# Altium project Main-PCB-v1.1.PrjPcb (part 2 of 2)

## Sheet Arc-Igniter-Sheet.SchDoc
size A4; SheetNumber: 3; SheetTotal: 4
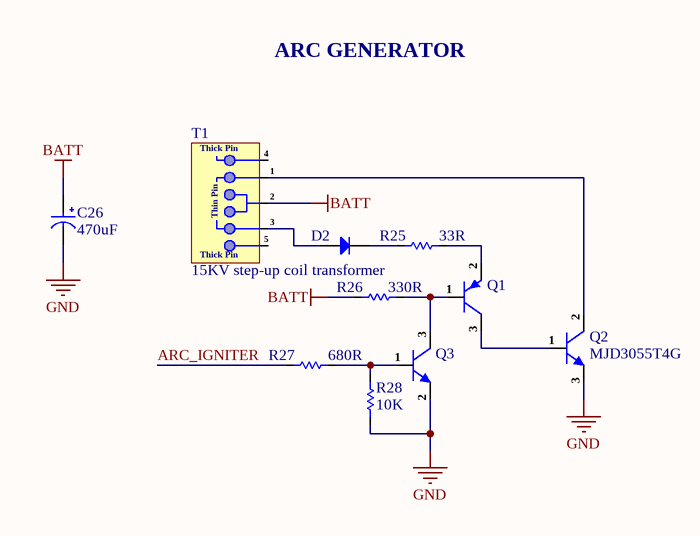
[diagram p2: Arc-Igniter-Sheet.SchDoc]

### Parts
C26  470uF  [Case-E]
D2  UF4007  [DO-41]  (value not drawn)
Q1  PMBT2907A,215  [SOT-23]  (value not drawn)
Q2  MJD3055T4G  [DPAK]
Q3  MMBT2222A-7-F  [SOT-23]  (value not drawn)
R25  33R  [MFR03SF330JA10]
R26  330R  [Res-0603]
R27  680R  [Res-0402]
R28  10K  [Res-0402]
T1  15KV step-up coil transformer  [15KV step-up coil transformer]

### Nets
BATT: C26.1 R26.1 T1.2
GND: C26.2 Q2.3(E) Q3.2(E) R28.1
ARC_IGNITER: R27.1
NetD2_1: D2.1(A) T1.3
NetD2_2: D2.2(K) R25.1
NetQ1_1: Q1.1(B) Q3.3(C) R26.2
NetQ1_2: Q1.2(E) R25.2
NetQ1_3: Q1.3(C) Q2.1(B)
NetQ2_2: Q2.2(C) T1.1
NetQ3_1: Q3.1(B) R27.2 R28.2

### Notes on the sheet
- ARC GENERATOR
- File:
- Title:
- Date:
- Page
- Num:
- Total:
- Drawn By: Huzaifa Ali
- (in symbol 15KV step-up coil transformer) Thick Pin; 4; Thin Pin; 5

### Library data of the parts
C26 = TAJE477K010RNJ: CAP TANT 470UF 10% 10V 2917; Manufacturer: Kyocera AVX; Dielectric Material: Tantalum; ESR (Equivalent Series Resistance): 500mR; Leakage Current: 47uA; Polarity: Polar; Item Type: Capacitor; Supplier 1: Arrow Electronics; Manufacturer Part Number: TAJE477K010RNJ; RoHS: Yes; Category: Tantalum Capacitors; Stock 1: 5; Pricing 1: 1=1.3181 (USD); Mounting Technology: Surface Mount,PCB; Case/Package: 2917; Pins: 2; Case Code (Imperial): 2917; Case Code (Metric): 7343; Min Operating Temperature: -55°C; Max Operating Temperature: 125°C; Value: 470uF; Tolerance: 10%; Packaging: Tape and Reel; Voltage Rating: 10V; Voltage Rating (DC): 10V; Package Quantity: 400; Termination: SMD/SMT; Voltage: 10V; Dissipation Factor: 10%; Features: General Purpose; Series: TAJ; Construction: Flat; Length: 7.3mm; Width: 4.3mm; Height: 4.1mm; Depth: 4.3mm; Lead Pitch: 4.4mm; Radiation Hardening: No; Reach SVHC Compliant: No; Lead Free: Lead Free; RoHS Compliant: Yes; ComponentLink1URL: https://datasheet.ciiva.com/7832/taj-7832508.pdf?src-supplier=Element14; ComponentLink1Description: https://datasheet.ciiva.com/7832/taj-7832508.pdf?src-supplier=Element14; ComponentLink2URL: https://datasheet.ciiva.com/7832/taj-7832507.pdf?src-supplier=Element14; ComponentLink2Description: https://datasheet.ciiva.com/7832/taj-7832507.pdf?src-supplier=Element14; ComponentLink3URL: https://datasheet.ciiva.com/265/taj-265547.pdf?src-supplier=Digi-Key; ComponentLink3Description: https://datasheet.ciiva.com/265/taj-265547.pdf?src-supplier=Digi-Key; ComponentLink4URL: https://datasheet.ciiva.com/265/taj-265546.pdf?src-supplier=Digi-Key; ComponentLink4Description: https://datasheet.ciiva.com/265/taj-265546.pdf?src-supplier=Digi-Key; ComponentLink5URL: https://datasheet.ciiva.com/265/taj-265548.pdf?src-supplier=Digi-Key; ComponentLink5Description: https://datasheet.ciiva.com/265/taj-265548.pdf?src-supplier=Digi-Key; ComponentLink6URL: https://datasheet.ciiva.com/12882/taj-27497-12882504.pdf?src-supplier=Mouser; ComponentLink6Description: https://datasheet.ciiva.com/12882/taj-27497-12882504.pdf?src-supplier=Mouser; ComponentLink7URL: https://datasheet.ciiva.com/14602/70001050-14602312.pdf?src-supplier=Allied+Electronics; ComponentLink7Description: https://datasheet.ciiva.com/14602/70001050-14602312.pdf?src-supplier=Allied+Electronics; ComponentLink8URL: https://datasheet.ciiva.com/14600/70001050-14600301.pdf?src-supplier=Allied+Electronics; ComponentLink8Description: https://datasheet.ciiva.com/14600/70001050-14600301.pdf?src-supplier=Allied+Electronics; ComponentLink9URL: https://datasheet.ciiva.com/11229/taj-11229470.pdf?src-supplier=Avnet; ComponentLink9Description: https://datasheet.ciiva.com/11229/taj-11229470.pdf?src-supplier=Avnet; ComponentLink10URL: https://datasheet.ciiva.com/16330/taj-16330918.pdf?src-supplier=Future+Electronics; ComponentLink10Description: https://datasheet.ciiva.com/16330/taj-16330918.pdf?src-supplier=Future+Electronics; Supplier Part Number 1: TAJE477K010RNJ; LCSC Part Number: C7234
D2 = UF4007: 1.7V@1A 75ns 1A 1kV DO-41 Fast Recovery / High Efficiency Diodes ROHS; Manufacturer: MDD(Microdiode Semiconductor); Item Type: Diode; Manufacturer Part Number: UF4007; Package: DO-41; LCSC Part Number: C960666; ComponentLink1Description: LCSC; ComponentLink1URL: https://www.lcsc.com/product-detail/Fast-Recovery-High-Efficiency-Diodes_MDD-Microdiode-Semiconductor-UF4007_C960666.html
Q1 = PMBT2907A,215: TRANS PNP 60V 0.6A TO236AB; Manufacturer: Nexperia; Collector Emitter Voltage (VCEO): -60V; Emitter Base Voltage (VEBO): -5V; Max Collector Current: -600mA; Polarity: 5054,5055Direction; Collector Emitter Saturation Voltage: -1.6V; hFE Min: 100NUMBER; Number of Elements: 1NUMBER; Power Dissipation: 250mW; Item Type: (BJT); Supplier: Arrow Electronics; LCSC Part Number: C8665; Manufacturer Part Number: PMBT2907A,215; RoHS: Yes; Category: BJTs; Stock: 441000; Pricing: 3000=0.018, 9000=0.017, 24000=0.016, 45000=0.015 (USD); Pins: 3NUMBER; Max Operating Temperature: 150°C; Collector Base Voltage (VCBO): -60V; Packaging: 10Packaging; Height: 1.1mm; ComponentLink1URL: https://media.digikey.com/pdf/Data%20Sheets/NXP%20PDFs/PMBT2907(A).pdf?src-supplier=Digikey; ComponentLink1Description: https://media.digikey.com/pdf/Data%20Sheets/NXP%20PDFs/PMBT2907(A).pdf?src-supplier=Digikey; ComponentLink2URL: http://www.farnell.com/datasheets/1914007.pdf?src-supplier=Farnell; ComponentLink2Description: http://www.farnell.com/datasheets/1914007.pdf?src-supplier=Farnell; ComponentLink3URL: https://datasheet.octopart.com/PMBT2907A%2C215-Nexperia-datasheet-87581832.pdf?src-supplier=Future+Electronics; ComponentLink3Description: https://datasheet.octopart.com/PMBT2907A%2C215-Nexperia-datasheet-87581832.pdf?src-supplier=Future+Electronics; ComponentLink4URL: https://datasheet.octopart.com/PMBT2907A%2C215-Nexperia-datasheet-38276499.pdf?src-supplier=Newark; ComponentLink4Description: https://datasheet.octopart.com/PMBT2907A%2C215-Nexperia-datasheet-38276499.pdf?src-supplier=Newark
Q2 = MJD3055T4G: TRANS NPN 60V 10A DPAK; Manufacturer: ON Semiconductor; Item Type: Mosfet; Supplier: Future Electronics; LCSC Part Number: C150250; Manufacturer Part Number: MJD3055T4G; RoHS: Yes; Stock: 2500; Pricing: 2500=0.27, 5000=0.265, 7500=0.26 (USD); ComponentLink1URL: https://datasheet.ciiva.com/7972/79237-7972276.pdf?src-supplier=Element14; ComponentLink1Description: https://datasheet.ciiva.com/7972/79237-7972276.pdf?src-supplier=Element14; ComponentLink2URL: https://datasheet.ciiva.com/15139/getdatasheetpartid-91662-15139167.pdf?src-supplier=Verical; ComponentLink2Description: https://datasheet.ciiva.com/15139/getdatasheetpartid-91662-15139167.pdf?src-supplier=Verical; ComponentLink3URL: https://datasheet.ciiva.com/16462/mjd2955-d-16462217.pdf?src-supplier=Future+Electronics; ComponentLink3Description: https://datasheet.ciiva.com/16462/mjd2955-d-16462217.pdf?src-supplier=Future+Electronics; ComponentLink4URL: https://datasheet.ciiva.com/6357/mjd2955-d-6357033.pdf?src-supplier=Digikey; ComponentLink4Description: https://datasheet.ciiva.com/6357/mjd2955-d-6357033.pdf?src-supplier=Digikey; ComponentLink5URL: https://datasheet.ciiva.com/981/mjd2955-d-981380.pdf?src-supplier=Digikey; ComponentLink5Description: https://datasheet.ciiva.com/981/mjd2955-d-981380.pdf?src-supplier=Digikey; ComponentLink6URL: https://datasheet.ciiva.com/981/mjd2955-d-981381.pdf?src-supplier=Digikey; ComponentLink6Description: https://datasheet.ciiva.com/981/mjd2955-d-981381.pdf?src-supplier=Digikey; ComponentLink7URL: https://datasheet.ciiva.com/11198/mjd2955-d-11198541.pdf?src-supplier=Avnet; ComponentLink7Description: https://datasheet.ciiva.com/11198/mjd2955-d-11198541.pdf?src-supplier=Avnet; ComponentLink8URL: https://datasheet.ciiva.com/11205/mjd2955-d-11205173.pdf?src-supplier=Avnet; ComponentLink8Description: https://datasheet.ciiva.com/11205/mjd2955-d-11205173.pdf?src-supplier=Avnet
Q3 = MMBT2222A-7-F: TRANS NPN 40V 0.6A SMD SOT23-3; Manufacturer: Diodes; Max Power Dissipation: 300mW; Collector Base Voltage (VCBO): 75V; Max Collector Current: 600mA; hFE Min: 100; Frequency: 300MHz; Number of Elements: 1; Emitter Base Voltage (VEBO): 6V; Collector Emitter Saturation Voltage: 1V; Power Dissipation: 350mW; Element Configuration: Single; Current: 1A; Item Type: Mosfet; Supplier 1: Digi-Key; Manufacturer Part Number: MMBT2222A-7-F; Stock 1: 2471182; Pricing 1: 1=0.15, 10=0.134, 100=0.0729, 500=0.04486, 1000=0.03059 (USD); Mount: Surface Mount; Case/Package: SOT-23; Number of Pins: 3; Weight: 0.000282oz; Contact Plating: Matte,Tin; Min Operating Temperature: -55°C; Max Operating Temperature: 150°C; Packaging: Tape and Reel; Collector Emitter Voltage (VCEO): 40V; Polarity: NPN; Voltage Rating (DC): 40V; Package Quantity: 3000; Continuous Collector Current: 600mA; Collector Emitter Breakdown Voltage: 40V; Transition Frequency: 300MHz; Max Breakdown Voltage: 40V; Max Frequency: 300MHz; Termination: SMD/SMT; Gain Bandwidth Product: 300MHz; Current Rating: 600mA; Voltage: 40V; Length: 3.05mm; Height: 1mm; Width: 1.4mm; Radiation Hardening: No; Lead Free: Lead Free; REACH SVHC: No SVHC; ComponentLink1URL: http://www.diodes.com/datasheets/ds30041.pdf?src-supplier=Future+Electronics; ComponentLink1Description: http://www.diodes.com/datasheets/ds30041.pdf?src-supplier=Future+Electronics; ComponentLink2URL: http://www.diodes.com/datasheets/ds30041.pdf?src-supplier=Avnet; ComponentLink2Description: http://www.diodes.com/datasheets/ds30041.pdf?src-supplier=Avnet; ComponentLink3URL: https://www.verical.com/server-webapp/html/getDatasheet?partID=82692&src-supplier=Verical; ComponentLink3Description: https://www.verical.com/server-webapp/html/getDatasheet?partID=82692&src-supplier=Verical; ComponentLink4URL: https://www.diodes.com/assets/Datasheets/ds30041.pdf?src-supplier=Digi-Key; ComponentLink4Description: https://www.diodes.com/assets/Datasheets/ds30041.pdf?src-supplier=Digi-Key; ComponentLink5URL: http://www.diodes.com/datasheets/ds30041.pdf?src-supplier=Avnet+Europe; ComponentLink5Description: http://www.diodes.com/datasheets/ds30041.pdf?src-supplier=Avnet+Europe; ComponentLink6URL: http://www.diodes.com/datasheets/ds30041.pdf?src-supplier=Element14; ComponentLink6Description: http://www.diodes.com/datasheets/ds30041.pdf?src-supplier=Element14; Supplier Part Number 1: MMBT2222A-FDIDKR-ND; LCSC Part Number: C94515
R25 = MFR03SF330JA10: Metal Film Resistors 33Ω 3W ±50ppm/℃ ±1% Plugin,D5xL15.5mm Through Hole Resistors ROHS; Manufacturer: UNI-ROYAL; Manufacturer Part Number: MFR03SF330JA10; Package: Plugin,D5xL15.5mm; LCSC Part Number: C58749; Item Type: Resistor; ComponentLink1Description: LCSC; ComponentLink1URL: https://www.lcsc.com/product-detail/Through-Hole-Resistors_UNI-ROYAL-Uniroyal-Elec-MFR03SF330JA10_C58749.html
R26 = RC0603JR-07330RL: RES  SMD 330R 100 mW 0603; Manufacturer: Yageo; Power Rating: 100mW; Tolerance: 5%; Voltage Rating (DC): 50V; Temperature Coefficient: 100ppm/°C; Item Type: Resistor; Supplier 1: Digi-Key; Manufacturer Part Number: RC0603JR-07330RL; RoHS: Yes; Category: Chip SMD Resistors; Stock 1: 1074593; Pricing 1: 1=0.10000, 10=0.02000, 100=0.00800, 1000=0.00360, 2500=0.00312 (USD); Case/Package: 0603; Number of Pins: 2; Case Code (Imperial): 0603; Case Code (Metric): 1608; Size Code: 0603; Min Operating Temperature: -55°C; Max Operating Temperature: 155°C; Resistance: 330R; Packaging: Tape and Reel; Voltage Rating: 50V; Package Quantity: 5000; Termination: SMD/SMT; Resistor Type: Thick Film; Features: Moisture Resistant; Series: RC; Max Power Dissipation: 100mW; Number of Terminations: 2; Resistance Tolerance: 5%; Construction: Rectangular; Length: 1.6mm; Width: 0.8mm; Height: 0.45mm; Depth: 0.8mm; REACH SVHC: No SVHC; Lead Free: Lead Free; Military Standard: Not; RoHS Compliant: Yes; Supplier Part Number 1: 311-330GRCT-ND; LCSC Part Number: C105879
R27 = RC0402FR-07680RL: RES 680 OHM 1% 1/16W 0402; Manufacturer: Yageo; Temperature Coefficient: 100ppm/°C; Power Rating: 63mW; Voltage Rating: 50V; Item Type: Resistor; Supplier 1: Future Electronics; Manufacturer Part Number: RC0402FR-07680RL; RoHS: Yes; Category: Chip SMD Resistors; Stock 1: 5080000; Pricing 1: 10000=0.0011, 100000=0.0011, 300000=0.001, 750000=0.001, 2000000=0.0009 (USD); Case/Package: 0402; Case Code (Imperial): 0402; Case Code (Metric): 1005; Size Code: 0402; Min Operating Temperature: -55°C; Max Operating Temperature: 155°C; Resistance: 680R; Tolerance: 1%; Packaging: Tape and Reel; Resistor Type: Thick Film; Termination: SMD/SMT; Features: Moisture Resistant; Series: RC; Max Power Dissipation: 63mW; Number of Terminations: 2; Resistance Tolerance: 1%; Construction: Rectangular; Voltage Rating (AC): 50V; Length: 1mm; Depth: 0.5mm; Reach SVHC Compliant: No; Lead Free: Lead Free; Military Standard: Not; RoHS Compliant: Yes; ComponentLink1URL: https://datasheet.ciiva.com/12667/pyu-rc0402-51-rohs-l-6-r-12667916.pdf?src-supplier=Mouser; ComponentLink1Description: https://datasheet.ciiva.com/12667/pyu-rc0402-51-rohs-l-6-r-12667916.pdf?src-supplier=Mouser; ComponentLink2URL: https://datasheet.ciiva.com/7850/1018594-7850071.pdf?src-supplier=Element14; ComponentLink2Description: https://datasheet.ciiva.com/7850/1018594-7850071.pdf?src-supplier=Element14; ComponentLink3URL: https://datasheet.ciiva.com/7850/1018594-7850070.pdf?src-supplier=Element14; ComponentLink3Description: https://datasheet.ciiva.com/7850/1018594-7850070.pdf?src-supplier=Element14; ComponentLink4URL: https://datasheet.ciiva.com/17042/pyu-rc0402-51-rohs-l-6-r-17042399.pdf?src-supplier=Future+Electronics; ComponentLink4Description: https://datasheet.ciiva.com/17042/pyu-rc0402-51-rohs-l-6-r-17042399.pdf?src-supplier=Future+Electronics; Supplier Part Number 1: 7948052
R28 = RC0402FR-0710KL: RES 10K OHM 1% 1/16W 0402; Manufacturer: Yageo; Resistance: 10kR; Voltage Rating (DC): 50V; Temperature Coefficient: 100ppm/°C; Power Rating: 62.5mW; Max Power Dissipation: 63mW; Item Type: Resistor; Supplier 1: Mouser; Manufacturer Part Number: RC0402FR-0710KL; RoHS: Yes; Category: Chip SMD Resistors; Stock 1: 18648329; Pricing 1: 1=0.10000, 10=0.01400, 50=0.01400, 100=0.00500, 1000=0.00300, 10000=0.00200 (USD); Case/Package: 0402; Number of Pins: 2; Case Code (Imperial): 0402; Case Code (Metric): 1005; Min Operating Temperature: -55°C; Max Operating Temperature: 155°C; Resistor Type: Thick Film; Tolerance: 1%; Packaging: Tape and Reel; Voltage Rating: 50V; Termination: SMD/SMT; Working Voltage: 50V; Number of Terminations: 2; Features: Moisture Resistant; Series: RC; Resistance Tolerance: 1%; Construction: Rectangular; Length: 1mm; Width: 0.5mm; Height: 0.32mm; Depth: 0.5mm; Lead Pitch: 0.2mm; REACH SVHC: No SVHC; Lead Free: Lead Free; RoHS Compliant: Yes; Military Standard: Not; ComponentLink1URL: https://datasheet.ciiva.com/7660/38568-7660787.pdf?src-supplier=Element14; ComponentLink1Description: https://datasheet.ciiva.com/7660/38568-7660787.pdf?src-supplier=Element14; ComponentLink2URL: https://datasheet.ciiva.com/7849/1686128-7849814.pdf?src-supplier=Element14; ComponentLink2Description: https://datasheet.ciiva.com/7849/1686128-7849814.pdf?src-supplier=Element14; ComponentLink3URL: https://datasheet.ciiva.com/7983/1018594-7983486.pdf?src-supplier=Element14; ComponentLink3Description: https://datasheet.ciiva.com/7983/1018594-7983486.pdf?src-supplier=Element14; ComponentLink4URL: https://datasheet.ciiva.com/22747/1018594-22747512.pdf?src-supplier=Element14; ComponentLink4Description: https://datasheet.ciiva.com/22747/1018594-22747512.pdf?src-supplier=Element14; ComponentLink5URL: https://datasheet.ciiva.com/12667/pyu-rc0402-51-rohs-l-6-r-12667067.pdf?src-supplier=Mouser; ComponentLink5Description: https://datasheet.ciiva.com/12667/pyu-rc0402-51-rohs-l-6-r-12667067.pdf?src-supplier=Mouser; ComponentLink6URL: https://datasheet.ciiva.com/7849/1784430-7849813.pdf?src-supplier=Element14; ComponentLink6Description: https://datasheet.ciiva.com/7849/1784430-7849813.pdf?src-supplier=Element14; ComponentLink7URL: https://datasheet.ciiva.com/7849/1784430-7849815.pdf?src-supplier=Element14; ComponentLink7Description: https://datasheet.ciiva.com/7849/1784430-7849815.pdf?src-supplier=Element14; Supplier Part Number 1: 603-RC0402FR-0710KL; LCSC Part Number: C60490
T1 = 15KV step-up coil transformer: 15KV Arc Ignition High Voltage Inverter Step Up Boost Coil Transformer Pulse Ignition 1.4x1.4x0.7cm Lighter Accessories; Manufacturer: Aideepen; Manufacturer Part Number: 15KV step-up coil transformer; Item Type: Transformer; ComponentLink1Description: Aliexpress; ComponentLink1URL: https://vi.aliexpress.com/item/1005006061113490.html

## Nets that join several sheets
3V3: Power-Sheet (5 pins), Controller-Sheet (14 pins)
5V-SOL-1: Power-Sheet (C10.2 C14.2 R4.2 U1.1), Controller-Sheet (TP5.1)
5V-SOL-2: Power-Sheet (C16.2 C17.2 R23.2 U4.1), Controller-Sheet (TP7.1)
BATT: Power-Sheet (11 pins), Arc-Igniter-Sheet (C26.1 R26.1 T1.2)
GND: Power-Sheet (36 pins), Controller-Sheet (42 pins), Arc-Igniter-Sheet (C26.2 Q2.3 Q3.2 R28.1)
5V_EN_1: Power-Sheet (R2.2 U1.5), Controller-Sheet (U6.12)
5V_EN_2: Power-Sheet (R22.2 U4.5), Controller-Sheet (U6.13)
ARC_IGNITER: Controller-Sheet (U6.16), Arc-Igniter-Sheet (R27.1)
I2C_SCL: Power-Sheet (U7.7), Controller-Sheet (R21.1 U6.20)
I2C_SDA: Power-Sheet (U7.8), Controller-Sheet (R20.1 U6.19)
USB_N: Power-Sheet (J2.A7 J2.B7), Controller-Sheet (R30.1)
USB_P: Power-Sheet (J2.A6 J2.B6), Controller-Sheet (R31.1)